# Altium schematic sheet Conversion3V3.SchDoc
size A3; SheetNumber: 5; SheetTotal: 9
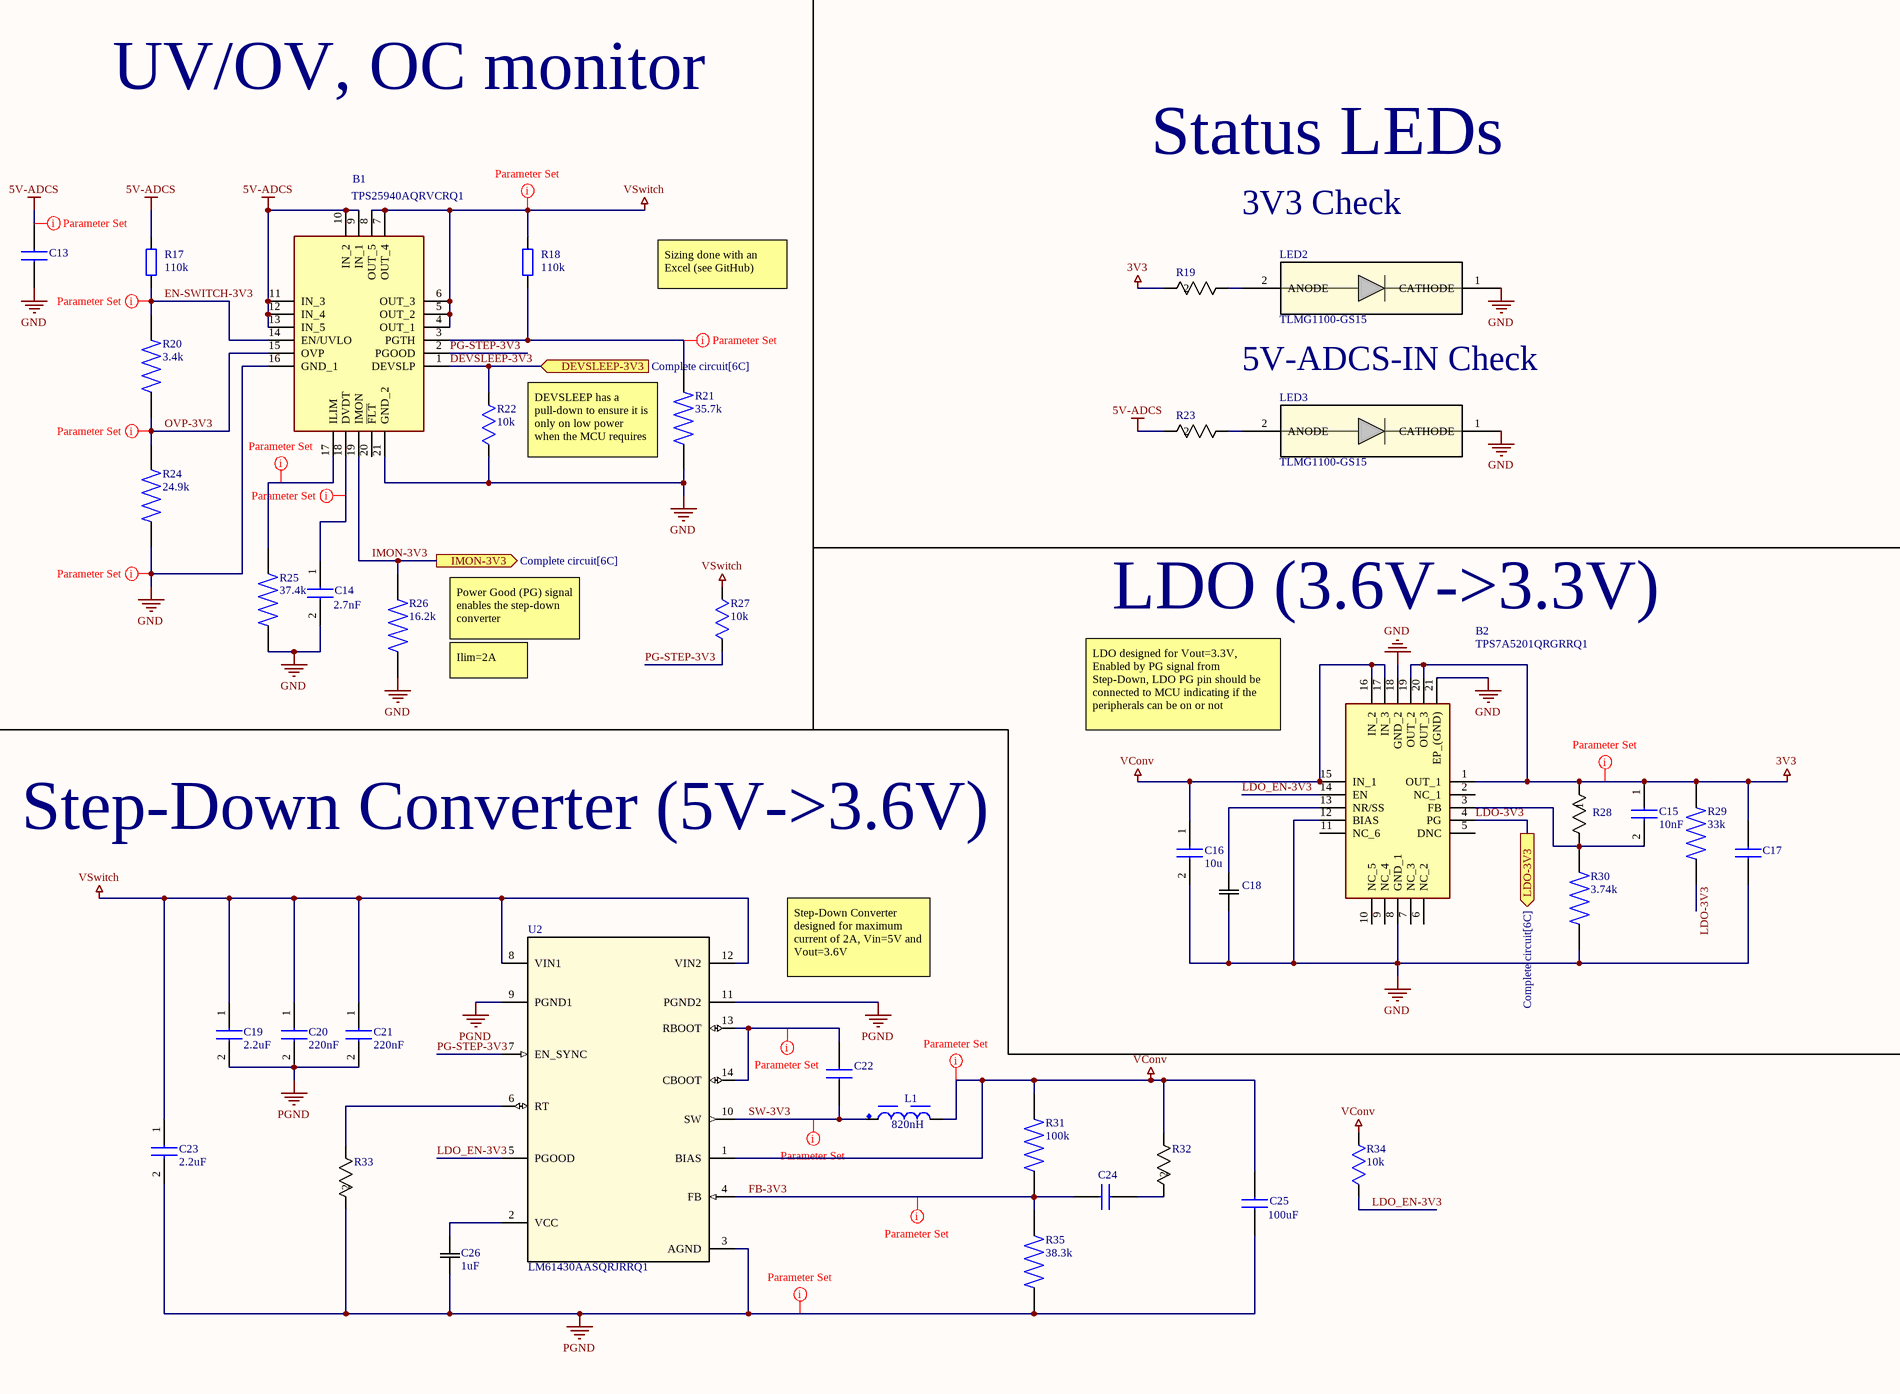
[diagram p0: Conversion3V3.SchDoc, right]

## Parts
B1  TPS25940AQRVCRQ1  [QFN50P300X400X80-21N]
B2  TPS7A5201QRGRRQ1  [QFN50P350X350X100-21N-D]
C13  C1206C104K3GACAUTO  [CAPC3216X180N]  (value not drawn)
C14  Capacitance: 2.7nF  [GCM188]  (hidden comment: GCM1885C1H272FA16J)
C15  Capacitance: 10nF  [C0805]  (hidden comment: C0805X103F5GACAUTO)
C16  Capacitance: 10u  [C0805]  (hidden comment: C0805X106J8RACAUTO)
C17  GCM31CR71A226KE02L  [CAPC3116X180N]  (value not drawn)
C18  C0603X103F3GACAUTO  [CAPC17795_95N_KEM]  (value not drawn)
C19  Capacitance: 2.2uF  [C0805]  (hidden comment: C0805X225J4RECAUTO)
C20  Capacitance: 220nF  [C1210_FT]  (hidden comment: C1210X224J3GACAUTO)
C21  Capacitance: 220nF  [C1210_FT]  (hidden comment: C1210X224J3GACAUTO)
C22  C1206C104K3GACAUTO  [CAPC3216X180N]  (value not drawn)
C23  Capacitance: 2.2uF  [C0805]  (hidden comment: C0805X225J4RECAUTO)
C24  06035A220F4T2A  [CAPC1608X90N]  (value not drawn)
C25  Capacitance: 100uF  [GRT32ER60J107ME13L]  (hidden comment: GRT32ER60J107ME13L)
C26  Capacitance: 1uF  [CAPC18095_95N_KEM]  (hidden comment: C0603X105J4RACAUTO)
L1  value 820nH  [WE-XHMI_4020]  (hidden comment: WE-XHMI_4020)
LED2  TLMG1100-GS15  [LED_0603_VIS]
LED3  TLMG1100-GS15  [LED_0603_VIS]
R17  value 110k  [WRIS-RSKS_0603_Reflow]  (hidden comment: 560112116148)
R18  value 110k  [WRIS-RSKS_0603_Reflow]  (hidden comment: 560112116148)
R19  MCT0603MD7502BP100  [RES_MCT_0603_VIS]  (value not drawn)
R20  value 3.4k  [RESC1508X60N]  (hidden comment: RQ73C1J3K4BTD)
R21  value 35.7k  [RES_ERJ-PB3B3572V]  (hidden comment: ERJ-PB3B3572V)
R22  value 10k  [RES_ERA3ARB103V]  (hidden comment: ERA3ARB103V)
R23  MCT0603MD7502BP100  [RES_MCT_0603_VIS]  (value not drawn)
R24  value 24.9k  [RESC1508X50N]  (hidden comment: RNCP0603FTD24K9)
R25  value 37.4k  [RESC1508X50N]  (hidden comment: RNCP0603FTD37K4)
R26  value 16.2k  [RESC1508X55N]  (hidden comment: RMCF0603FT16K2)
R27  value 10k  [RES_ERA3ARB103V]  (hidden comment: ERA3ARB103V)
R28  TNPW080511K8BEEN  [RES_TNPW0805_VIS]  (value not drawn)
R29  value 33k  [RESC1608X55N]  (hidden comment: RN73R1JTTD3302F10)
R30  value 3.74k  [RESC2012X55N]  (hidden comment: TNPW08053K74DEEA)
R31  value 100k  [RESC1608X55N]  (hidden comment: TNPU0603100KAZEN00)
R32  CRCW06031K00FKEA  [RES_CRCW_0603]  (value not drawn)
R33  CRCW06035K76FKEA  [RC0603N_VIS]  (value not drawn)
R34  value 10k  [RES_ERA3ARB103V]  (hidden comment: ERA3ARB103V)
R35  value 38.3k  [RES_ERJPA3F3832V]  (hidden comment: ERJPA3F3832V)
U2  LM61430AASQRJRRQ1  [RJR0014A-MFG]

## Ports
DEVSLEEP-3V3 (in, see Complete circuit[6C]), IMON-3V3 (out, see Complete circuit[6C]), LDO-3V3 (out, see Complete circuit[6C])

## Nets
3V3: B2.1(OUT_1) B2.19(OUT_2) B2.20(OUT_3) C15.1 C17.2 R19.2 R28.1 R29.2
5V-ADCS: B1.9(IN_1) B1.10(IN_2) B1.11(IN_3) B1.12(IN_4) B1.13(IN_5) C13.1 R17.1 R23.2
GND: B1.16(GND_1) B1.21(GND_2) B2.8(GND_1) B2.12(BIAS) B2.18(GND_2) B2.21(EP_(GND)) C13.2 C14.2 C16.2 C17.1 C18.1 LED2.1(CATHODE) LED3.1(CATHODE) R21.1 R22.1 R24.1 R25.1 R26.1 R30.1
PGND: C19.2 C20.2 C21.2 C23.2 C25.1 C26.1 R33.2 R35.1 U2.3(AGND) U2.9(PGND1) U2.11(PGND2)
VConv: B2.15(IN_1) B2.16(IN_2) B2.17(IN_3) C16.1 C25.2 L1.2 R31.2 R32.1 R34.2 U2.1(BIAS)
VSwitch: B1.4(OUT_1) B1.5(OUT_2) B1.6(OUT_3) B1.7(OUT_4) B1.8(OUT_5) C19.1 C20.1 C21.1 C23.1 R18.1 R27.1 U2.8(VIN1) U2.12(VIN2)
DEVSLEEP-3V3: B1.1(DEVSLP) R22.2 ; port DEVSLEEP-3V3
EN-SWITCH-3V3: B1.14(EN/UVLO) R17.2 R20.2
FB-3V3: C24.1 R31.1 R35.2 U2.4(FB)
IMON-3V3: B1.19(IMON) R26.2 ; port IMON-3V3
LDO-3V3: B2.4(PG) R29.1 ; port LDO-3V3
LDO_EN-3V3: B2.14(EN) R34.1 U2.5(PGOOD)
OVP-3V3: B1.15(OVP) R20.1 R24.2
PG-STEP-3V3: B1.2(PGOOD) R27.2 U2.7(EN_SYNC)
SW-3V3: C22.2 L1.1 U2.10(SW)
NetB1_3: B1.3(PGTH) R18.2 R21.2
NetB1_17: B1.17(ILIM) R25.2
NetB1_18: B1.18(DVDT) C14.1
NetB2_3: B2.3(FB) C15.2 R28.2 R30.2
NetB2_13: B2.13(NR/SS) C18.2
NetC22_1: C22.1 U2.13(RBOOT) U2.14(CBOOT)
NetC24_2: C24.2 R32.2
NetC26_2: C26.2 U2.2(VCC)
NetLED2_2: LED2.2(ANODE) R19.1
NetLED3_2: LED3.2(ANODE) R23.1
NetR33_1: R33.1 U2.6(RT)

Not connected (* = marked no-connect by the designer): B1 20(~{FLT}); B2 2(NC_1) 5(DNC) 6(NC_2) 7(NC_3) 9(NC_4) 10(NC_5) 11(NC_6)

## Layout directives
net class SupplyMax: 5V-ADCS, NetC22_1, SW-3V3
net class SupplyMin: 3V3, (no net found under the mark), EN-SWITCH-3V3, FB-3V3, GND, NetB1_3, NetB1_17, NetB1_18, OVP-3V3, PGND, VConv, VSwitch

## Notes on the sheet
- UV/OV, OC monitor
- Status LEDs
- 3V3 Check
- Sizing done with an Excel (see GitHub)
- 5V-ADCS-IN Check
- DEVSLEEP has a pull-down to ensure it is only on low power when the MCU requires
- LDO (3.6V->3.3V)
- Power Good (PG) signal enables the step-down converter
- Ilim=2A
- LDO designed for Vout=3.3V, Enabled by PG signal from Step-Down, LDO PG pin should be connected to MCU indicating if the peripherals can be on or not
- Step-Down Converter (5V->3.6V)
- Step-Down Converter designed for maximum current of 2A, Vin=5V and Vout=3.6V

## Library data of the parts
B1 = CMP-011-00016-1: 2.7V-18V Automotive Current-Limited Load Switch with Current Sense & Short-to-Battery Protection; Manufacturer_Name: Texas Instruments; Geometry.Height: 0.8mm; Source: TPS25940AQRVCRQ1.SchLib; Datasheet Link: http://www.ti.com/lit/gpn/tps25940-q1; Design Item ID: TPS25940AQRVCRQ1; Mouser Price/Stock: https://www.mouser.co.uk/ProductDetail/Texas-Instruments/TPS25940AQRVCRQ1?qs=osPbIpHqQ9Uam0Tf4VM8lQ%3D%3D; Mouser Part Number: 595-TPS25940AQRVCRQ1; Manufacturer_Part_Number: TPS25940AQRVCRQ1
B2 = CMP-306-000000-1: Automotive 2A High-Accuracy Low-Noise Low-Dropout (LDO) Voltage Regulator; Manufacturer_Name: Texas Instruments; Geometry.Height: 1mm; Datasheet Link: http://www.ti.com/lit/gpn/tps7a52-q1; Mouser Price/Stock: https://www.mouser.co.uk/ProductDetail/Texas-Instruments/TPS7A5201QRGRRQ1?qs=1mbolxNpo8cdxsbFt%252By4TQ%3D%3D; Source: TPS7A5201QRGRRQ1.SchLib; Manufacturer_Part_Number: TPS7A5201QRGRRQ1; Mouser Part Number: 595-TPS7A5201QRGRRQ1; Design Item ID: TPS7A5201QRGRRQ1
C13 C22 = CMP-001-00115-2: SMD Auto C0G, Ceramic, 0.1 uF, 10%, 25 VDC, 62.5 VDC, 125C, -55C, C0G, SMD, MLCC, Ultra-Stable, Low Loss, Automotive Grade, 0.1 % , 10 GOhms, 36 mg, 1206, 3.2mm, 1.6mm, 1.6mm, 0.5mm, 2000, 78  Weeks, 120; Manufacturer_Name: KEMET; Geometry.Height: 1.8mm; Design Item ID: C1206C104K3GACAUTO; Manufacturer_Part_Number: C1206C104K3GACAUTO; Source: C1206C104K3GACAUTO.SchLib; Datasheet Link: https://content.kemet.com/datasheets/KEM_C1022_C0G_AUTO_SMD.pdf; Mouser Part Number: 80-C1206C104K3GAUTO; Mouser Price/Stock: https://www.mouser.co.uk/ProductDetail/KEMET/C1206C104K3GACAUTO?qs=iLbezkQI%252BsiL409OZdKKSA%3D%3D
C14 = GCM1885C1H272FA16J: Multilayer Ceramic Capacitors MLCC - SMD/SMT 2700 pF 50 VDC 1% 0603 C0G (NP0) AEC-Q200; Manufacturer_Name: Murata Electronics; Datasheet Link: https://search.murata.co.jp/Ceramy/image/img/A01X/G101/ENG/GCM1885C1H272FA16-01A.pdf; Height: 0.9mm; Manufacturer_Part_Number: GCM1885C1H272FA16J
C15 = C0805X103F5GACAUTO: Multilayer Ceramic Capacitors MLCC - SMD/SMT 50V 0.01uF C0G 0805 1% Flex AEC-Q200; Manufacturer_Name: Yageo Group; Datasheet Link: https://www.yageogroup.com/content/datasheet/asset/file/KEM_C1062_C0G_FT-CAP_SMD; Height: 1.1mm; Manufacturer_Part_Number: C0805X103F5GACAUTO; Mouser Part Number: 80-C0805X103F5GAUTO; Mouser Price/Stock: https://www.mouser.co.uk/ProductDetail/KEMET/C0805X103F5GACAUTO?qs=ds50AKTGxA8kafziiLAE7w%3D%3D
C16 = C0805X106J8RACAUTO: Multilayer Ceramic Capacitors MLCC - SMD/SMT 10 Vo 10 uF 0805 X7R 5 % AECQ200; Manufacturer_Name: Yageo Group; Datasheet Link: https://www.yageogroup.com/content/datasheet/asset/file/KEM_C1078_X7R_FT-CAP_AUTO_SMD; Height: 1.1mm; Manufacturer_Part_Number: C0805X106J8RACAUTO; Mouser Part Number: 80-C0805X106J8RAUTO; Mouser Price/Stock: https://www.mouser.co.uk/ProductDetail/KEMET/C0805X106J8RACAUTO?qs=HXFqYaX1Q2wKi4kcOiFe3g%3D%3D; Arrow Part Number: C0805X106J8RACAUTO; Arrow Price/Stock: https://www.arrow.com/en/products/c0805x106j8racauto/kemet-corporation
C17 = CMP-001-00127-1: Capacitor GCM31 L=3.2mm W=1.6mm T=1.6mm; Manufacturer_Name: Murata Electronics; Geometry.Height: 1.8mm; Mouser Price/Stock: https://www.mouser.co.uk/ProductDetail/Murata-Electronics/GCM31CR71A226KE02L?qs=9UHcxq0qN4vtutbd1jidnA%3D%3D; Source: GCM31CR71A226KE02L.SchLib; Datasheet Link: https://search.murata.co.jp/Ceramy/image/img/A01X/G101/ENG/GCM31CR71A226KE02-01A.pdf; Design Item ID: GCM31CR71A226KE02L; Manufacturer_Part_Number: GCM31CR71A226KE02L; Mouser Part Number: 81-GCM31CR71A226KE2L
C18 = CMP-001-00116-2: SMD Auto C0G Flex, Ceramic, 0.01 uF, 1%, 25 VDC, C0G, SMD, MLCC, FT-CAP, Ultra-Stable, Automotive Grade, 0603; Manufacturer_Name: Kemet; Copyright: Copyright (C) 2025 Ultra Librarian. All rights reserved.; Design Item ID: C0603X103F3GACAUTO; Manufacturer_Part_Number: C0603X103F3GACAUTO; Source: C0603X103F3GACAUTO.SchLib
C19 C23 = C0805X225J4RECAUTO: Capacitor; Manufacturer_Name: Yageo Group; Datasheet Link: https://www.yageogroup.com/content/datasheet/asset/file/KEM_C1090_X7R_ESD; Height: 1.1mm; Manufacturer_Part_Number: C0805X225J4RECAUTO; Mouser Part Number: 80-C0805X225J4RECAUT; Mouser Price/Stock: https://www.mouser.co.uk/ProductDetail/KEMET/C0805X225J4RECAUTO?qs=55YtniHzbhAubLJhOOO7lw%3D%3D; Arrow Part Number: C0805X225J4RECAUTO; Arrow Price/Stock: https://www.arrow.com/en/products/c0805x225j4recauto/kemet-corporation
C20 C21 = C1210X224J3GACAUTO: Multilayer Ceramic Capacitors MLCC - SMD/SMT 25V 0.22uF C0G 1210 5% Flex AEC-Q200; Manufacturer_Name: Yageo Group; Datasheet Link: https://www.yageogroup.com/content/datasheet/asset/file/KEM_C1062_C0G_FT-CAP_SMD; Manufacturer_Part_Number: C1210X224J3GACAUTO; Mouser Part Number: 80-C1210X224J3GAUTO; Mouser Price/Stock: https://www.mouser.co.uk/ProductDetail/KEMET/C1210X224J3GACAUTO?qs=gZXFycFWdAOsiS4yZkrXAg%3D%3D
C24 = CMP-001-00126-1: Multilayer Ceramic Capacitors MLCC - SMD/SMT 50V 22pF C0G 0603 1% Tol; Manufacturer_Name: Kyocera AVX; Geometry.Height: 0.9mm; Datasheet Link: https://componentsearchengine.com/Datasheets/1/06035A220F4T2A.pdf; Mouser Price/Stock: https://www.mouser.com/Search/Refine.aspx?Keyword=581-06035A220F4T2A; Manufacturer_Part_Number: 06035A220F4T2A; Source: 06035A220F4T2A.SchLib; Design Item ID: 06035A220F4T2A; Mouser Part Number: 581-06035A220F4T2A
C25 = CMP-001-00135-2: Multilayer Ceramic Capacitors MLCC - SMD/SMT 100 uF 6.3 VDC 20% 1210 X5R AEC-Q200; Manufacturer_Name: Murata Electronics; Geometry.Height: 2.7mm; Mouser Part Number: 81-GRT32ER60J107ME3L; Design Item ID: GRT32ER60J107ME13L; Manufacturer_Part_Number: GRT32ER60J107ME13L; Capacitor Type: Ceramic; Mouser Price/Stock: https://www.mouser.co.uk/ProductDetail/Murata-Electronics/GRT32ER60J107ME13L?qs=drgMNd%252BkGPOgdf3ISYHnDQ%3D%3D; Source: GRT32ER60J107ME13L.SchLib; Datasheet Link: https://search.murata.co.jp/Ceramy/image/img/A01X/G101/ENG/GRT32ER60J107ME13-01A.pdf
C26 = CMP-001-00117-3: SMD Auto X7R Flex, Ceramic, 1 uF, 5%, 16 VDC, X7R, SMD, MLCC, FT-CAP, Automotive Grade, 0603; Manufacturer_Name: Kemet; Copyright: Copyright (C) 2025 Ultra Librarian. All rights reserved.; Source: C0603X105J4RACAUTO.SchLib; Manufacturer_Part_Number: C0603X105J4RACAUTO; Design Item ID: C0603X105J4RACAUTO
L1 = CMP-006-00031-1: Size 4020; L = 0.82 ÂµH Â±20%; IR = 10.80 A; Isat = 11.60 A; RDCmax = 11.0 mâ„; MF: Wurth Elektronik; MP: 744393230082; Design Item ID: WE-XHMI_4020; Source: WE-XHMI_4020.SchLib; Case/Package: None; SnapEDA_Link: https://www.snapeda.com/parts/744393230082/Wurth+Electronics/view-part/?ref=snap; Component Type: Standard; Pins: 2; Check_prices: https://www.snapeda.com/parts/744393230082/Wurth+Electronics/view-part/?ref=eda
LED2 LED3 = CMP-007-00036-1: CHIPLED(SMD 0603-LED) GREEN U.BRIGHT-e4; Manufacturer_Name: Vishay; RefDes: RefDes; Copyright: Copyright (C) 2025 Ultra Librarian. All rights reserved.; Type: Type; Design Item ID: TLMG1100-GS15; Manufacturer_Part_Number: TLMG1100-GS15; Source: TLMG1100-GS15.SchLib
R17 R18 = CMP-009-00240-1: WRIS-RSKS Thick Film Resistor, size 0603, 110kO, +/-1%, 100mW; Manufacturer: Wurth Elektronik; Temperature Coefficient of Resistance Min: -100ppm/°C; Temperature Coefficient of Resistance Max: 100ppm/°C; Limiting Element Voltage: 75V; Length: 1.6mm; Rated Power: 100mW; Category: Thick Film Resistors; Resistance Tolerance: +/-1%; Source: WRIS-RSKS.SchLib; Height: 0.45mm; Case/Package: 0603; ComponentLink2Description: Datasheet Link; Match Code: WRIS-RSKS; Mount: Surface Mount; Width: 0.8mm; Packaging: Tape and Reel; Component Type: Standard; ComponentLink1URL: https://www.we-online.com/redexpert/article/560112116148?ad; Min Operating Temperature: -55°C; Design Item ID: 560112116148; Max Operating Temperature: 155°C; ComponentLink2URL: https://www.we-online.com/redexpert/spec/560112116148?ad; Pins: 2; ComponentLink1Description: Website Link; Manufacturer Part Number: 560112116148
R19 R23 = CMP-009-00216-2: MCT 0603-25 0.1% AT P1 75K; Manufacturer_Name: Vishay; Source: MCT0603MD7502BP100.SchLib; Copyright: Copyright (C) 2025 Ultra Librarian. All rights reserved.; Design Item ID: MCT0603MD7502BP100; Manufacturer_Part_Number: MCT0603MD7502BP100
R20 = CMP-009-00210-1: MP: RQ73C1J3K4BTD; Pins: 2; Source: RQ73C1J3K4BTD.SchLib; Price: None; Availability: Unavailable; Design Item ID: RQ73C1J3K4BTD; Component Type: Standard; Case/Package: None
R21 = CMP-009-00261-1: Series/Type: High Precision Thick Film Chip Resistors , Power Rating (W): 0.2, Chip Size (LxW(EIA)) (mm): 1.6 x 0.8 (EIA:0603), Resistance Values (â„; MF: Panasonic; MP: ERJ-PB3B3572V; Check_prices: https://www.snapeda.com/parts/ERJ-PB3B3572V/Panasonic/view-part/?ref=eda; Component Type: Standard; Case/Package: 603-2 Panasonic; Source: ERJ-PB3B3572V.SchLib; SnapEDA_Link: https://www.snapeda.com/parts/ERJ-PB3B3572V/Panasonic/view-part/?ref=snap; Pins: 2; Design Item ID: ERJ-PB3B3572V
R22 R27 R34 = CMP-009-00245-3: Thin Film Resistors - SMD 0603 10Kohm 0.1% 10ppm AEC-Q200; Design Item ID: ERA3ARB103V; Case/Package: None; Pins: 2; Source: ERA3ARB103V.SchLib; Component Type: Standard; MP: ERA3ARB103V; Availability: Unavailable; Price: None
R24 = CMP-009-00241-1: Res Thin Film 0603 24.9K Ohm 1% 0.125W(1/8W) Â±100ppm/C Sulfur Resistant Pad SMD T/R; MF: Stackpole Electronics Inc; Pins: 2; Case/Package: 1508 Stackpole; MP: RNCP0603FTD24K9; SnapEDA_Link: https://www.snapeda.com/parts/RNCP0603FTD24K9/Stackpole+Electronics/view-part/?ref=snap; Design Item ID: RNCP0603FTD24K9; Source: RNCP0603FTD24K9.SchLib; Component Type: Standard; Check_prices: https://www.snapeda.com/parts/RNCP0603FTD24K9/Stackpole+Electronics/view-part/?ref=eda
R25 = CMP-009-00243-2: 37.4 kOhms ±1% 0.125W, 1/8W Chip Resistor 0603 (1608 Metric) Anti-Sulfur Thin Film; MP: RNCP0603FTD37K4; Component Type: Standard; Pins: 2; Case/Package: None; Availability: Unavailable; Source: RNCP0603FTD37K4.SchLib; Design Item ID: RNCP0603FTD37K4; Price: None
R26 = CMP-009-00266-2: 16.2 kOhms ±1% 0.1W, 1/10W Chip Resistor 0603 (1608 Metric) Automotive AEC-Q200 Thick Film; Component Type: Standard; Pins: 2; Design Item ID: RMCF0603FT16K2; Source: RMCF0603FT16K2.SchLib; Availability: Unavailable; MP: RMCF0603FT16K2; Price: None; Case/Package: None
R28 = CMP-009-00233-2: TNPW0805 11K8 0.1% T-9 E52 e3; Manufacturer_Name: Vishay; Datasheet: https://www.vishay.com/doc?28758; Source: TNPW080511K8BEEN.SchLib; Copyright: Copyright (C) 2026 Ultra Librarian. All rights reserved.; Design Item ID: TNPW080511K8BEEN; Manufacturer_Part_Number: TNPW080511K8BEEN
R29 = CMP-009-00222-1: 33 kOhms Â±1% 0.125W, 1/8W Chip Resistor 0603 (1608 Metric) Automotive AEC-Q200, Moisture Resistant Thin Film; MF: KOA Speer; MP: RN73R1JTTD3302F10; Component Type: Standard; Check_prices: https://www.snapeda.com/parts/RN73R1JTTD3302F10/KOA+Speer/view-part/?ref=eda; Source: RN73R1JTTD3302F10.SchLib; Case/Package: 603 KOA; Pins: 2; Design Item ID: RN73R1JTTD3302F10; SnapEDA_Link: https://www.snapeda.com/parts/RN73R1JTTD3302F10/KOA+Speer/view-part/?ref=snap
R30 = CMP-009-00234-1: TNPW0805 3K74 0.5% T-9 ET1 E3; Component Type: Standard; Pins: 2; Availability: Unavailable; Source: TNPW08053K74DEEA.SchLib; Design Item ID: TNPW08053K74DEEA; Case/Package: None; MP: TNPW08053K74DEEA; Price: None
R31 = CMP-009-00208-1: 100 kOhms Â±0.05% 0.1W, 1/10W Chip Resistor 0603 (1608 Metric) Anti-Sulfur, Automotive AEC-Q200, Moisture Resistant Thin Film; MF: Vishay; MP: TNPU0603100KAZEN00; Component Type: Standard; Pins: 2; SnapEDA_Link: https://www.snapeda.com/parts/TNPU0603100KAZEN00/Vishay/view-part/?ref=snap; Design Item ID: TNPU0603100KAZEN00; Source: TNPU0603100KAZEN00.SchLib; Case/Package: 1608 Vishay; Check_prices: https://www.snapeda.com/parts/TNPU0603100KAZEN00/Vishay/view-part/?ref=eda
R32 = CMP-009-00227-2: D11/CRCW0603 100 1K 1% ET1 e3; Manufacturer_Name: Vishay; Source: CRCW06031K00FKEA.SchLib; Copyright: Copyright (C) 2026 Ultra Librarian. All rights reserved.; Design Item ID: CRCW06031K00FKEA; Manufacturer_Part_Number: CRCW06031K00FKEA
R33 = CMP-009-00232-2: D11/CRCW0603 100 5K76 1% ET1 e3; Manufacturer_Name: Vishay; Manufacturer_Part_Number: CRCW06035K76FKEA; Design Item ID: CRCW06035K76FKEA; Datasheet: https://www.vishay.com/doc?20035; Source: CRCW06035K76FKEA.SchLib; Copyright: Copyright (C) 2026 Ultra Librarian. All rights reserved.
R35 = CMP-009-00273-1: Res, Aec-Q200, Thick Film, 38K3, 0603; MP: ERJ-PA3F3832V; MF: Panasonic; Pins: 2; Check_prices: https://www.snapeda.com/parts/ERJ-PA3F3832V/Panasonic/view-part/?ref=eda; Component Type: Standard; Case/Package: 1608-2 Panasonic; SnapEDA_Link: https://www.snapeda.com/parts/ERJ-PA3F3832V/Panasonic/view-part/?ref=snap; Source: ERJPA3F3832V.SchLib; Design Item ID: ERJPA3F3832V
U2 = CMP-226-000001-2: Automotive 3-V to 36-V, 3-A, low-noise synchronous step-down converter 14-VQFN-HR -40 to 150; Manufacturer_Name: Texas Instruments; Copyright: Copyright (C) 2026 Ultra Librarian. All rights reserved.; Design Item ID: LM61430AASQRJRRQ1; RefDes: RefDes; TYPE: TYPE; Manufacturer_Part_Number: LM61430AASQRJRRQ1; Source: LM61430AASQRJRRQ1.SchLib